# EasyEDA Pro project ESP32S3_DMX_RDM_2026-06-09.epro, schematic Schematic

## Sheets
1 P1: Create Date: 2026-06-09; Page Name: P1; Project Name: ESP32S3_DMX_RDM_2026-06-09; Schematic Name: Schematic1; Update Date: 2026-06-09; Company: 嘉立创EDA; Page Size: A3; Version: V1.0
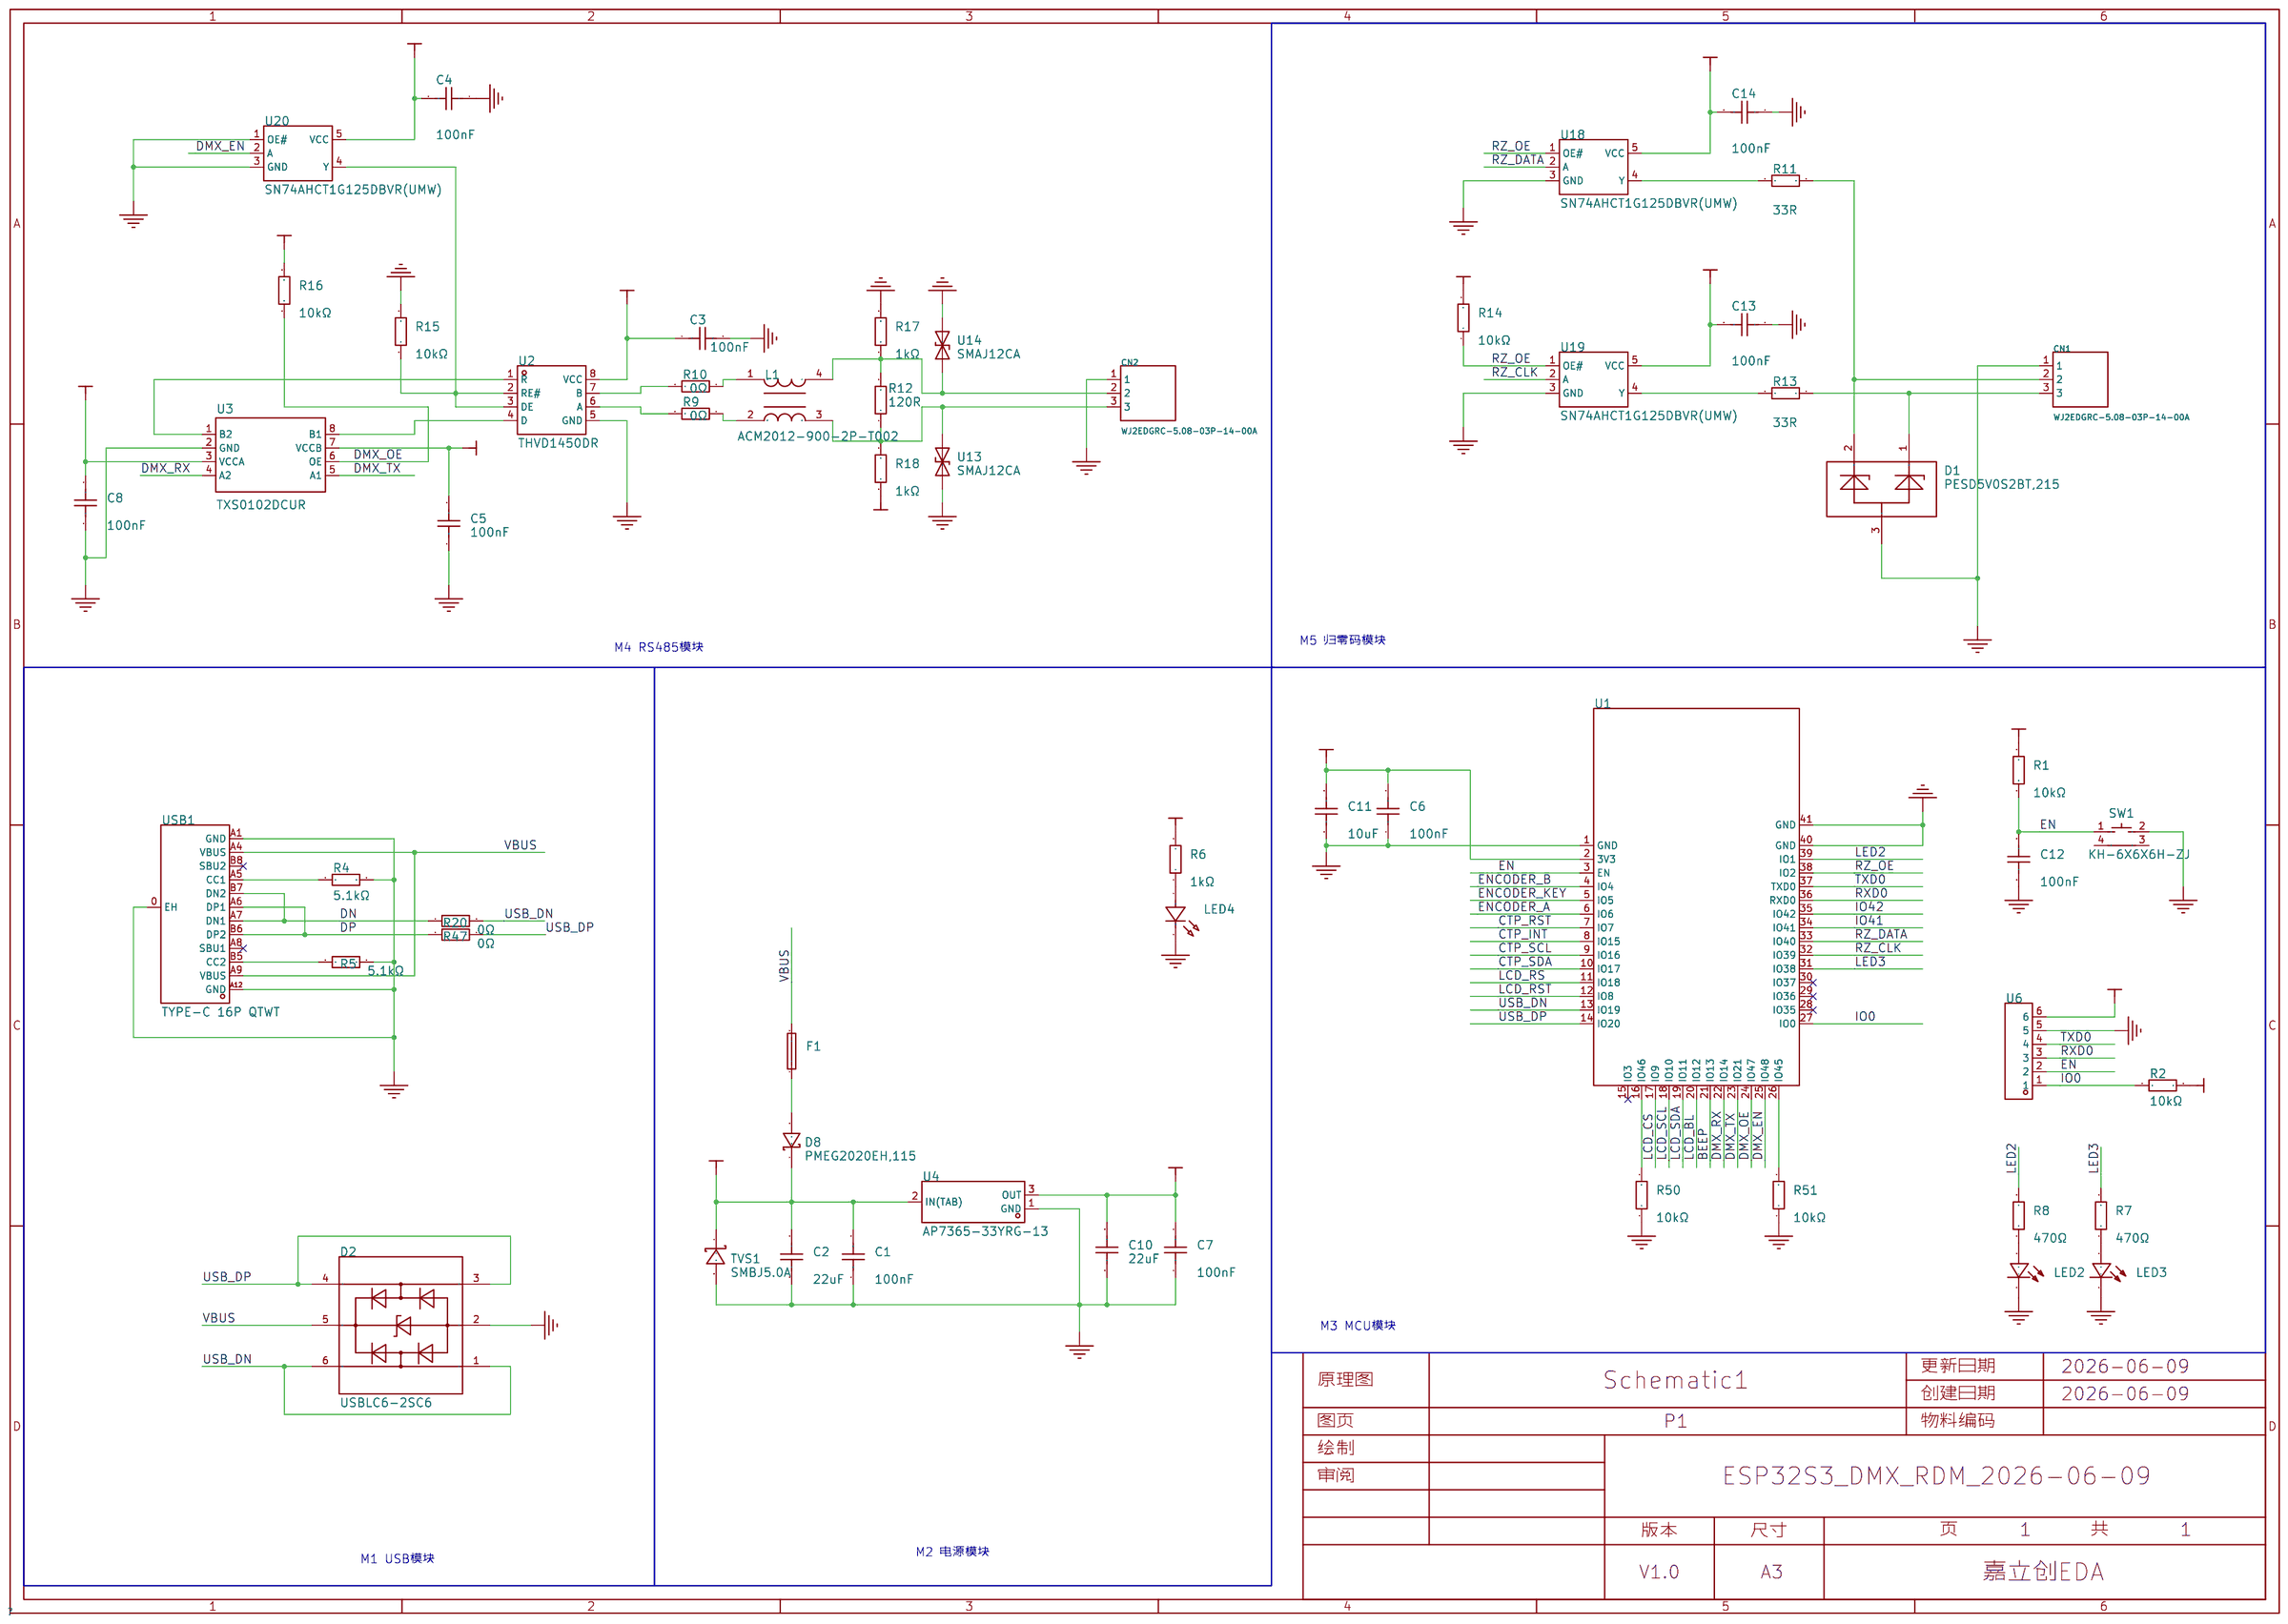
[diagram p3: P1]
2 P2: Create Date: 2026-06-11; Page Name: P2; Schematic Name: Schematic; Update Date: 2026-06-11
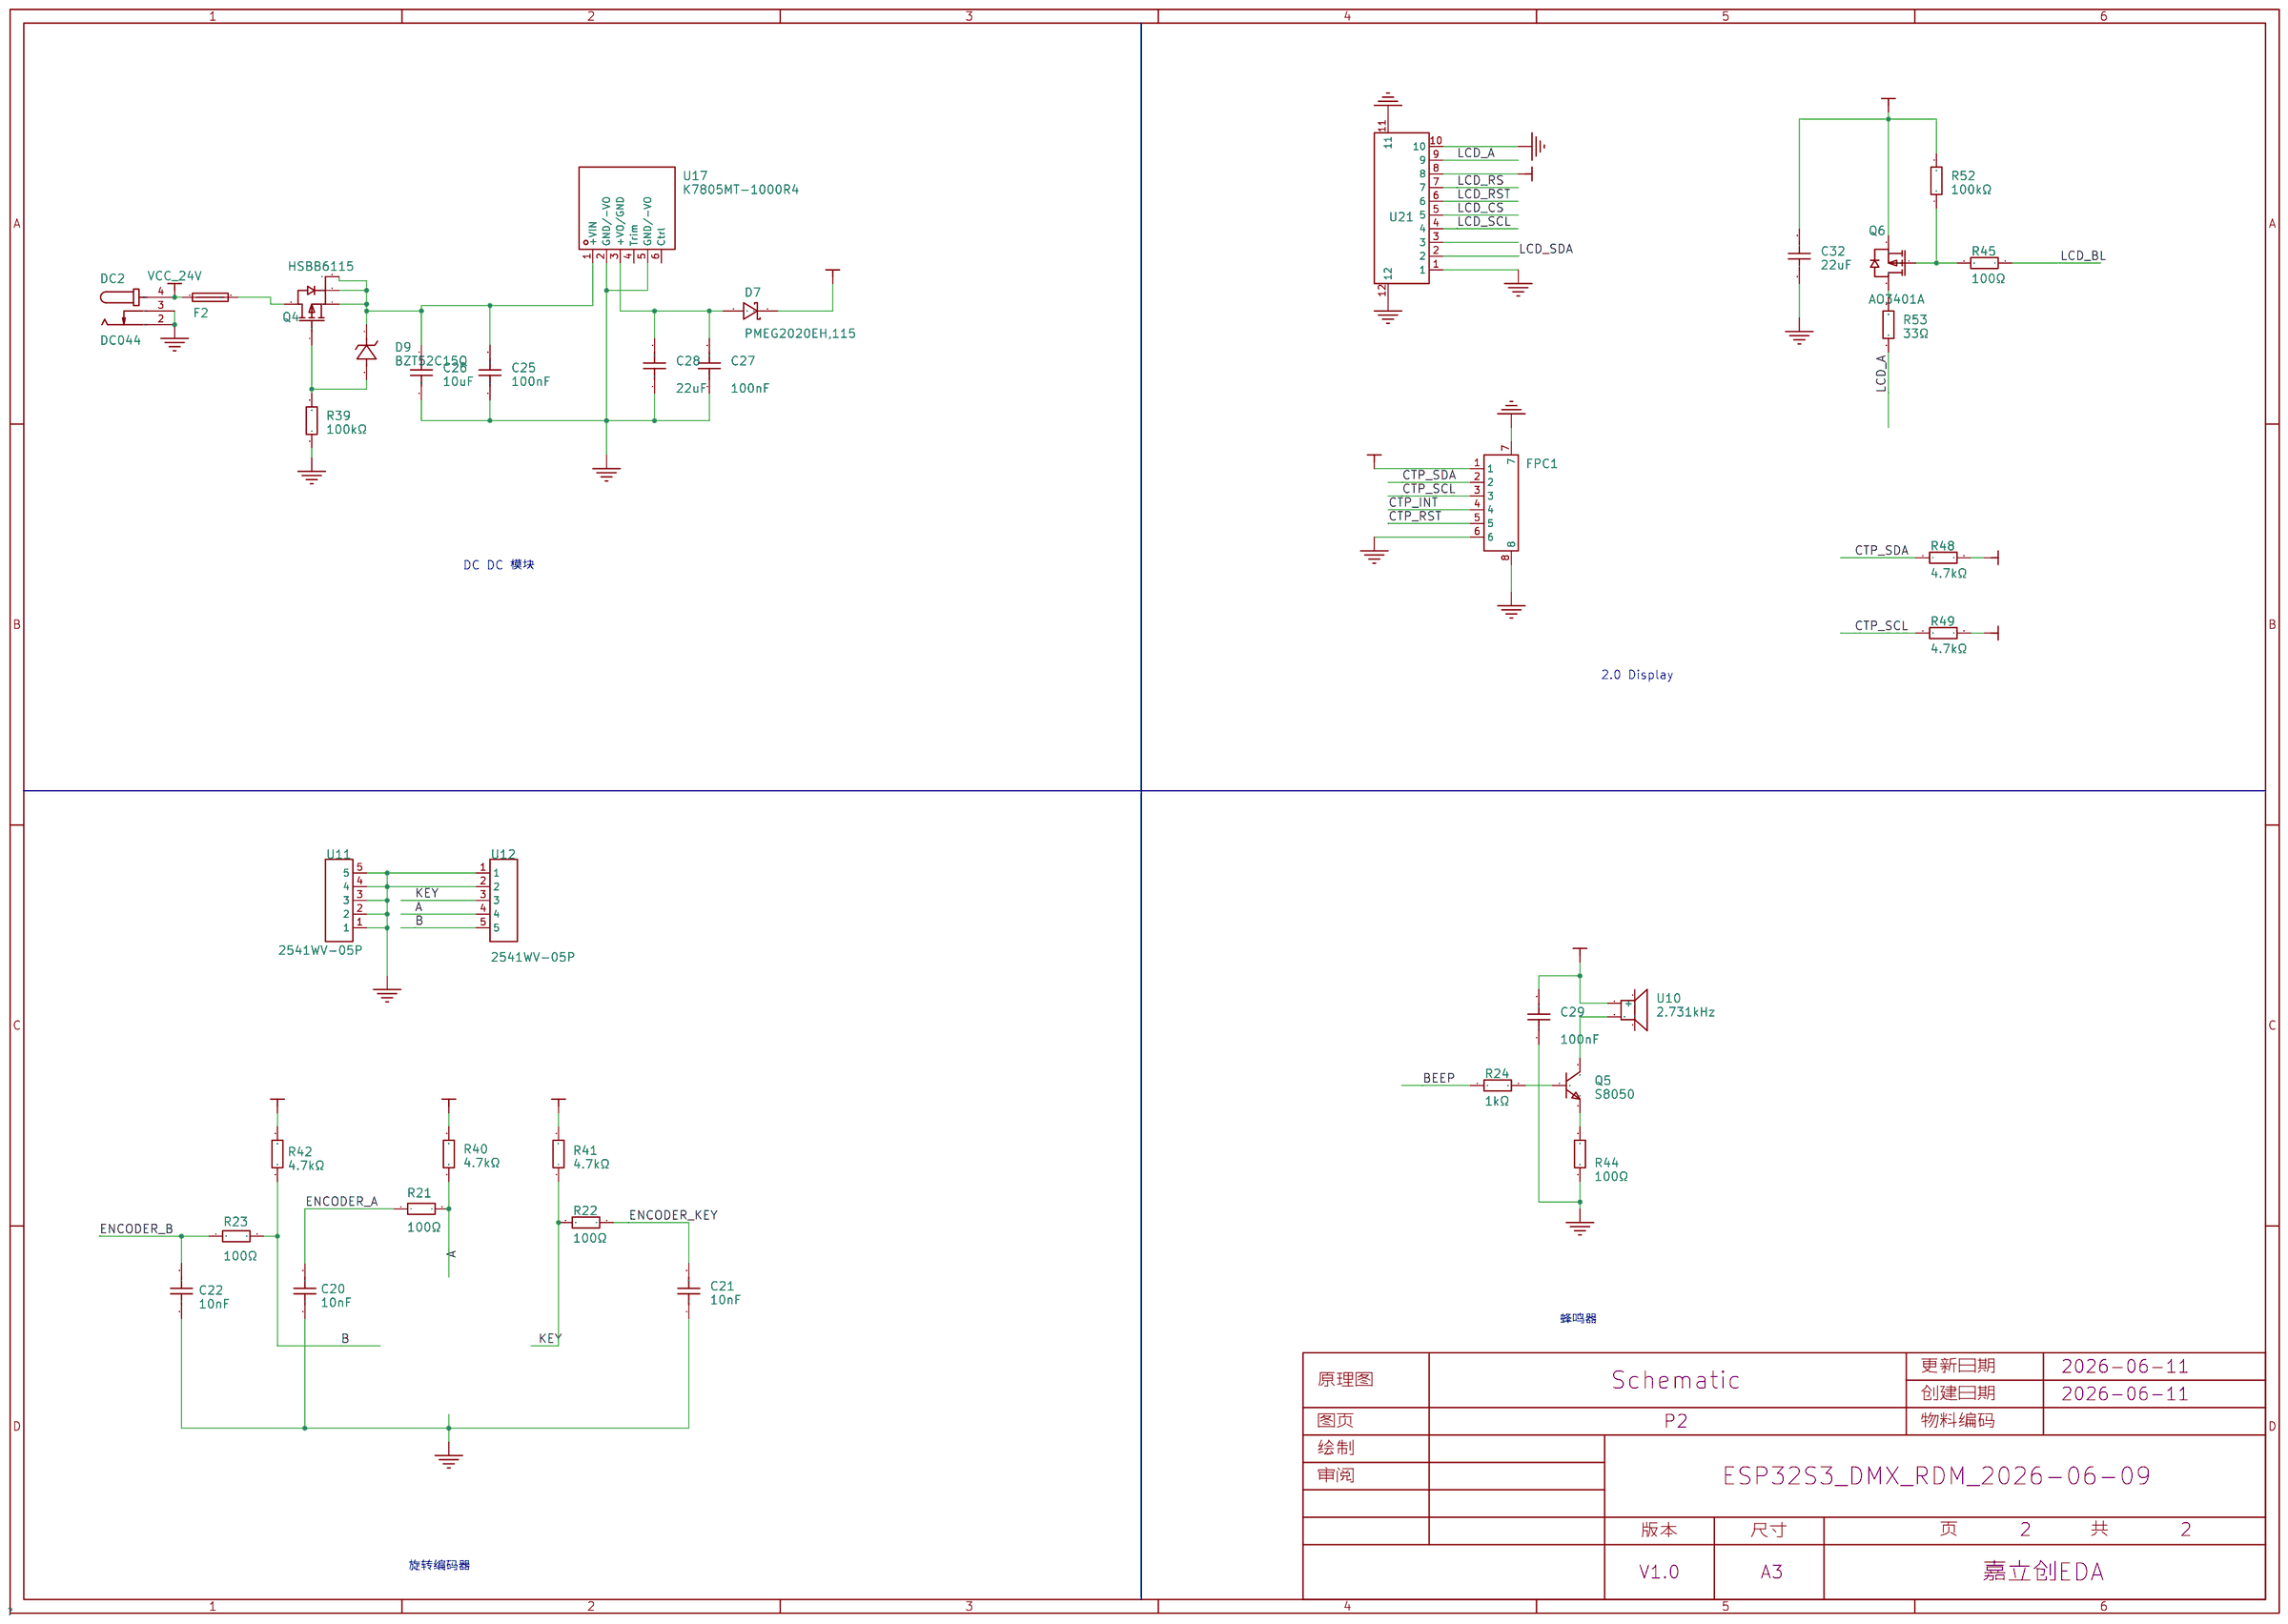
[diagram p4: P2]

## Parts
sheet P1
C1  100nF  [C0805]
C2  22uF  [C0805]
C3  100nF  [C0805]
C4  100nF  [C0805]
C5  100nF  [C0805]
C6  100nF  [C0805]
C7  100nF  [C0805]
C8  100nF  [C0805]
C10  22uF  [C0805]
C11  10uF  [C0805]
C12  100nF  [C0805]
C13  100nF  [C0805]
C14  100nF  [C0805]
CN1  WJ2EDGRC-5.08-03P-14-00A  [CONN-TH_3P-P5.08_WJ2EDGRC-5.08-3P]
CN2  WJ2EDGRC-5.08-03P-14-00A  [CONN-TH_3P-P5.08_WJ2EDGRC-5.08-3P]
D1  PESD5V0S2BT,215  [SOT-23_L2.9-W1.3-P1.90-LS2.4-BR]
D2  USBLC6-2SC6  [SOT-23-6_L2.9-W1.6-P0.95-LS2.8-BL]
D8  PMEG2020EH,115  [SOD-123FL_L2.6-W1.6-LS3.4-R-FD]
F1  1206L050/36NR  [F1206]
L1  ACM2012-900-2P-T002  [IND-SMD_4P-L2.0-W1.2-TL]
LED2  MHK1375CGBTD  [LED-TH_MHK1375CGBTD]
LED3  MHK1375CGBTD  [LED-TH_MHK1375CGBTD]
LED4  MHK1375CRBTD  [LED-TH_MHK1375CRBTD]
R1  10kΩ  [R0805]
R2  10kΩ  [R0805]
R4  5.1kΩ  [R0805]
R5  5.1kΩ  [R0805]
R6  1kΩ  [R0805]
R7  470Ω  [R0805]
R8  470Ω  [R0805]
R9  0Ω  [R0805]
R10  0Ω  [R0805]
R11  33R  [R0805]
R12  120R  [R0805]
R13  33R  [R0805]
R14  10kΩ  [R0805]
R15  10kΩ  [R0805]
R16  10kΩ  [R0805]
R17  1kΩ  [R0805]
R18  1kΩ  [R0805]
R20  0Ω  [R0805]
R47  0Ω  [R0805]
R50  10kΩ  [R0805]
R51  10kΩ  [R0805]
SW1  KH-6X6X6H-ZJ  [SW-TH_KH-6X6X6H-ZJ-A]
TVS1  SMBJ5.0A  [SMB_L4.6-W3.6-LS5.3-RD]
U1  2.4GHz  [WIRELM-SMD_ESP32-S3-WROOM-1]
U2  THVD1450DR  [SOIC-8_L4.9-W3.9-P1.27-LS6.0-BL]
U3  TXS0102DCUR  [VSON8_L2.0-W2.3-P0.50-LS3.1-BL]
U4  AP7365-33YRG-13  [SOT-89-3_L4.5-W2.5-P1.50-LS4.2-BR]
U6  DS1024-1x6R2  [HDR-TH_6P-P2.54-H-F-W10.0-N]
U13  SMAJ12CA  [SMA_L4.3-W2.7-LS5.1-BI]
U14  SMAJ12CA  [SMA_L4.3-W2.7-LS5.1-BI]
U18  SN74AHCT1G125DBVR(UMW)  [SOT-23-5_L3.0-W1.5-P0.95-LS2.8-BL]
U19  SN74AHCT1G125DBVR(UMW)  [SOT-23-5_L3.0-W1.5-P0.95-LS2.8-BL]
U20  SN74AHCT1G125DBVR(UMW)  [SOT-23-5_L3.0-W1.5-P0.95-LS2.8-BL]
USB1  TYPE-C 16P QTWT  [USB-TYPE-C-SMD_TYPE-C-16P-QTWT]
sheet P2
C20  10nF  [C0805]
C21  10nF  [C0805]
C22  10nF  [C0805]
C25  100nF  [C0805]
C26  10uF  [C0805]
C27  100nF  [C0805]
C28  22uF  [C0805]
C29  100nF  [C0805]
C32  22uF  [C0805]
D7  PMEG2020EH,115  [SOD-123FL_L2.6-W1.6-LS3.4-R-FD]
D9  BZT52C15Q  [SOD-123_L2.6-W1.7-LS3.5-RD]
DC2  DC044  [DC-IN-TH_DC044]
F2  1206L050/36NR  [F1206]
FPC1  05B20L06P  [FPC-SMD_6P-P0.50_05B20L06P]
Q4  HSBB6115  [DFN-8_L3.0-W3.0-P0.65-BL-1]
Q5  S8050  [SOT-23-3_L2.9-W1.3-P1.90-LS2.4-BR]
Q6  AO3401A  [SOT-23-3_L2.9-W1.3-P1.90-LS2.4-BR]
R21  100Ω  [R0805]
R22  100Ω  [R0805]
R23  100Ω  [R0805]
R24  1kΩ  [R0805]
R39  100kΩ  [R0805]
R40  4.7kΩ  [R0805]
R41  4.7kΩ  [R0805]
R42  4.7kΩ  [R0805]
R44  100Ω  [R0805]
R45  100Ω  [R0805]
R48  4.7kΩ  [R0805]
R49  4.7kΩ  [R0805]
R52  100kΩ  [R0805]
R53  33Ω  [R0805]
U10  2.731kHz  [BUZ-SMD_4P-L8.5-W8.5-P8.50-TL-A]
U11  2541WV-05P  [HDR-TH_5P-P2.54-V-M]
U12  2541WV-05P  [HDR-TH_5P-P2.54-V-M]
U17  K7805MT-1000R4  [PWRM-SMD_K78XXMT-1000R4]
U21  HC-FPC-0.5-10P-CSH20  [FPC-SMD_10P-P0.50_HC-FPC-0.5-10P-CSH20]

## Library data of the parts
C1 C3-C8 C12-C14 C25 C27 C29 = CC0805KRX7R9BB104: 容值:100nF;精度:±10%;额定电压:50V;温度系数:X7R;; LCSC Part Name: 100nF ±10% 50V; Supplier Part: C49678; Manufacturer: YAGEO(国巨); Supplier Footprint: 0805; JLCPCB Part Class: Basic Part; Datasheet: https://item.szlcsc.com/datasheet/CC0805KRX7R9BB104/50686.html; Supplier: LCSC; Tolerance: ±10%; Voltage Rating: 50V; Temperature Coefficient: X7R
C2 C10 C28 C32 = GRM21BR61A226ME51K: 容值:22uF;精度:±20%;额定电压:10V;温度系数:X5R;; LCSC Part Name: 22uF ±20% 10V; Supplier Part: GRM21BR61A226ME51K.1; Manufacturer: muRata(村田); Supplier Footprint: 0805; JLCPCB Part Class: Extended Part; Datasheet: https://item.szlcsc.com/datasheet/GRM21BR61A226ME51K/2269894.html; Supplier: LCSC; Tolerance: ±20%; Voltage Rating: 10V; Temperature Coefficient: X5R
C11 = GRM21BR61C106KE15K: 容值:10uF;精度:±10%;额定电压:16V;温度系数:X5R;; LCSC Part Name: 10uF ±10% 16V; Supplier Part: GRM21BR61C106KE15K.1; Manufacturer: muRata(村田); Supplier Footprint: 0805; JLCPCB Part Class: Extended Part; Datasheet: https://item.szlcsc.com/datasheet/GRM21BR61C106KE15K/397163.html; Supplier: LCSC; Tolerance: ±10%; Voltage Rating: 16V; Temperature Coefficient: X5R
CN1 CN2 = WJ2EDGRC-5.08-03P-14-00A: 连接器类型:板端/插座-闭口;固定方式:卡扣固定;结构:1x3P;间距:5.08mm;颜色:绿色;安装方式:弯插;排数:1;每排PIN数:3;额定电流:10A;额定电压:300V;线规 - AWG:-;线规 - 平方毫米:-;工作温度:-40℃~+105℃;; LCSC Part Name: 卡扣固定 1x3P 5.08mm 排数:1 每排P数:3; Supplier Part: C8377; Manufacturer: KANGNEX(康奈克斯电气); Supplier Footprint: 弯插,P=5.08mm; JLCPCB Part Class: Extended Part; Datasheet: https://item.szlcsc.com/datasheet/WJ2EDGRC-5.08-03P-14-00A/8871.html; Supplier: LCSC; Connector Type: 板端/插座-闭口; Termination Style: 卡扣固定; Number of Positions or Pins: 1x3P; Pitch: 5.08mm; Color: 绿色; Mounting Type: 弯插; Number of Pins: 3P; Number of Rows: 1; Number of PINs Per Row: 3; Current Rating: 10A; Voltage Rating (Max): 300V; Operating Temperature: -40℃~+105℃
D1 = PESD5V0S2BT,215: 极性:双向;反向截止电压(Vrwm):5V;钳位电压:14V;峰值脉冲电流(Ipp):12A;峰值脉冲功率(Ppp):130W@8/20us;击穿电压:5.5V;; LCSC Part Name: 双向ESD; Supplier Part: C49338; Manufacturer: Nexperia(安世); Supplier Footprint: SOT-23; JLCPCB Part Class: Extended Part; Datasheet: https://item.szlcsc.com/datasheet/PESD5V0S2BT%252C215/50346.html; Supplier: LCSC; Polarity: 双向; Reverse Stand-Off Voltage (Vrwm): 5V; Clamping Voltage: 14V; Peak Pulse Current (Ipp): 12A; Peak Pulse Power Dissipation (Ppp): 130W@8/20us; Voltage - Breakdown: 5.5V; Reverse Leakage Current (Ir): 5nA; Number of Channels: 双路; level of protection: IEC 61000-4-5；IEC 61000-4-2; Type: ESD; Junction Capacitance: 35pF
D2 = USBLC6-2SC6_C7519: 极性:单向;反向截止电压(Vrwm):5.25V;钳位电压:17V;峰值脉冲电流(Ipp):5A;击穿电压:6V;; LCSC Part Name: 单向ESD; Supplier Part: USBLC6-2SC6.1; Manufacturer: ST(意法半导体); Supplier Footprint: SOT-23-6L; JLCPCB Part Class: Extended Part; Datasheet: https://item.szlcsc.com/datasheet/USBLC6-2SC6/7996.html; Supplier: LCSC; Polarity: 单向; Reverse Stand-Off Voltage (Vrwm): 5.25V; Clamping Voltage: 17V; Peak Pulse Current (Ipp): 5A; Voltage - Breakdown: 6V; Reverse Leakage Current (Ir): 150nA; Number of Channels: 双路; Operating Temperature: -40℃~+125℃; level of protection: IEC 61000-4-2; Type: ESD; Junction Capacitance: 3.5pF
D7 D8 = PMEG2020EH,115: 二极管配置:1个独立式;正向压降(Vf):525mV@2A;直流反向耐压(Vr):20V;整流电流:2A;; LCSC Part Name: 电压:20V 电流:2A; Supplier Part: C456104; Manufacturer: Nexperia(安世); Supplier Footprint: SOD-123F; JLCPCB Part Class: Extended Part; Datasheet: https://item.szlcsc.com/datasheet/PMEG2020EH%252C115/458867.html; Supplier: LCSC; Diode Configuration: 1个独立式; Voltage - Forward(Vf@If): 525mV@2A; Voltage - DC Reverse(Vr): 20V; Current - Rectified: 2A; Reverse Leakage Current (Ir): 200uA@20V; Non-Repetitive Peak Forward Surge Current: 9A
F1 F2 = 1206L050/36NR: 最大电压:36V;最大电流:10A;保持电流:500mA;跳闸电流:1A;; Supplier Part: C20616702; Manufacturer: LUTE(陆特); Supplier Footprint: 1206; JLCPCB Part Class: 扩展库; Datasheet: https://atta.szlcsc.com/upload/public/pdf/source/20240126/B80C6588635F950DA87838E3E9CE2355.pdf; Supplier: LCSC; Operating Voltage (Max): 36V; Current Rating (Max): 10A; Hold Current: 500mA; Trip Current: 1A; Power Dissipation: 1W; Resistance - Initial (Ri) (Min): 150mΩ; Resistance - Post Trip (R1) (Max): 850mΩ; Maximum Time to Trip: 100ms; Operating Temperature: -40℃~+85℃; Voltage - Max: 16V; Current - Max: 40A; Time to Trip(Max): 1.5s; Length: 3.6mm; Width: 1.9mm; Height: 1.6mm
L1 = ACM2012-900-2P-T002: 通道数:2;电感@频率:-;阻抗@频率:90Ω@100MHz;直流电阻(DCR):190mΩ;; LCSC Part Name: 两路 贴片共模滤波器 阻抗90Ω@100MHz 停产; Supplier Part: C19972; Manufacturer: TDK; Supplier Footprint: SMD-4P,2x1.2mm; JLCPCB Part Class: Extended Part; Datasheet: https://item.szlcsc.com/datasheet/ACM2012-900-2P-T002/20681.html; Supplier: LCSC; Number of Lines: 2; Current Rating: 400mA; Impedance @ Frequency: 90Ω@100MHz; Voltage Rating - DC: 50V; Voltage Withstand: 50V; DC Resistance(DCR): 190mΩ; Operating Temperature: -40℃~+85℃
LED2 LED3 = MHK1375CGBTD: 灯头类型:组装式圆形灯头;发光颜色:黄绿色;功率:78mW;正向电流:20mA;主波长:568nm;二极管配置:-;透镜颜色:雾状绿透镜;色温:-;发光角度:80°;载带方式:-;工作温度:-25℃~+85℃;; LCSC Part Name: 普绿/黄绿; Supplier Part: C409769; Manufacturer: MEIHUA(美华); Supplier Footprint: 插件,P=2.54mm; JLCPCB Part Class: 扩展库; Datasheet: https://atta.szlcsc.com/upload/public/pdf/source/20190807/C409769_BD2FEBD402124B53381C1A24DEF8BEC4.pdf; Supplier: LCSC; Lamp Holder Type: 组装式圆形灯头; Emitted Color: 黄绿色; Power Dissipation: 78mW; Forward Current: 20mA; Dominant Wavelength: 568nm; Lens Color: 雾状绿透镜; Viewing Angle: 80°; Operating Temperature: -25℃~+85℃
LED4 = MHK1375CRBTD: 灯头类型:-;发光颜色:红色;正向压降(Vf):2.05V;功率:75mW;正向电流:20mA;波长:628nm;二极管配置:-;透镜颜色:雾状红透镜;色温:-;发光角度:60°;载带方式:-;工作温度:-25℃~+85℃;; LCSC Part Name: 红灯; Supplier Part: C2764901; Manufacturer: MEIHUA(美华); Supplier Footprint: 插件,P=2.54mm; JLCPCB Part Class: 扩展库; Datasheet: https://item.szlcsc.com/datasheet/MHK1375CRBTD/2899589.html; Supplier: LCSC; Illumination Color: 红色; Voltage - Forward(Vf): 2.05V; Power(Watts): 75mW; Forward Current: 20mA; Wavelength - Dominant: 628nm; Lens Color: 雾状红透镜; Viewing Angle: 60°; Operating Temperature: -25℃~+85℃
R1 R2 R14-R16 R50 R51 = RC0805JR-0710KL: 电阻类型:厚膜电阻;阻值:10kΩ;精度:±5%;功率:125mW;最大工作电压:150V;温度系数:±100ppm/℃;; LCSC Part Name: 厚膜电阻 10kΩ ±5% 125mW; Supplier Part: C100047; Manufacturer: YAGEO(国巨); Supplier Footprint: 0805; JLCPCB Part Class: Extended Part; Datasheet: https://atta.szlcsc.com/upload/public/pdf/source/20170708/1499509500945.pdf; Supplier: LCSC; Type: 厚膜电阻; Tolerance: ±5%; Power(Watts): 125mW; Overload Voltage (Max): 150V; Temperature Coefficient: ±100ppm/℃; Operating Temperature Range: -55℃~+155℃
R4 R5 = RC0805FR-075K1L: 电阻类型:厚膜电阻;阻值:5.1kΩ;精度:±1%;功率:125mW;工作电压:150V;温度系数:±100ppm/℃;; LCSC Part Name: 厚膜电阻 5.1kΩ ±1% 125mW; Supplier Part: C84375; Manufacturer: YAGEO(国巨); Supplier Footprint: 0805; JLCPCB Part Class: Extended Part; Datasheet: https://item.szlcsc.com/datasheet/RC0805FR-075K1L/85545.html; Supplier: LCSC; Type: 厚膜电阻; Tolerance: ±1%; Power(Watts): 125mW; Voltage-Supply(Max): 150V; Temperature Coefficient: ±100ppm/℃; Operating Temperature: -55℃~+155℃
R6 R17 R18 R24 = RC0805JR-071KL: 电阻类型:厚膜电阻;阻值:1kΩ;精度:±5%;功率:125mW;最大工作电压:150V;温度系数:±100ppm/℃;; LCSC Part Name: 厚膜电阻 1kΩ ±5% 125mW; Supplier Part: C100046; Manufacturer: YAGEO(国巨); Supplier Footprint: 0805; JLCPCB Part Class: Extended Part; Datasheet: https://atta.szlcsc.com/upload/public/pdf/source/20170708/1499509500945.pdf; Supplier: LCSC; Type: 厚膜电阻; Tolerance: ±5%; Power(Watts): 125mW; Overload Voltage (Max): 150V; Temperature Coefficient: ±100ppm/℃; Operating Temperature Range: -55℃~+155℃
R7 R8 = RC0805FR-07470RL: 电阻类型:厚膜电阻;阻值:470Ω;精度:±1%;功率:125mW;工作电压:150V;温度系数:±100ppm/℃;; LCSC Part Name: 厚膜电阻 470Ω ±1% 125mW; Supplier Part: C114564; Manufacturer: YAGEO(国巨); Supplier Footprint: 0805; JLCPCB Part Class: Extended Part; Datasheet: https://item.szlcsc.com/datasheet/RC0805FR-07470RL/115808.html; Supplier: LCSC; Type: 厚膜电阻; Tolerance: ±1%; Power(Watts): 125mW; Voltage-Supply(Max): 150V; Temperature Coefficient: ±100ppm/℃; Operating Temperature: -55℃~+155℃
R9 R10 R20 R47 = RC0805FR-070RL: 电阻类型:厚膜电阻;阻值:0Ω;精度:±1%;功率:125mW;工作电压:150V;温度系数:-;; LCSC Part Name: 厚膜电阻 0Ω ±1% 125mW; Supplier Part: C100045; Manufacturer: YAGEO(国巨); Supplier Footprint: 0805; JLCPCB Part Class: Extended Part; Datasheet: https://item.szlcsc.com/datasheet/RC0805FR-070RL/101259.html; Supplier: LCSC; Type: 厚膜电阻; Tolerance: ±1%; Power(Watts): 125mW; Voltage-Supply(Max): 150V; Operating Temperature: -55℃~+155℃
R11 R13 = RC0805FR-0733RL: 电阻类型:厚膜电阻;阻值:33Ω;精度:±1%;功率:125mW;工作电压:150V;温度系数:±100ppm/℃;; LCSC Part Name: 厚膜电阻 33Ω ±1% 125mW; Supplier Part: RC0805FR-0733RL.1; Manufacturer: YAGEO(国巨); Supplier Footprint: 0805; JLCPCB Part Class: Extended Part; Datasheet: https://item.szlcsc.com/datasheet/RC0805FR-0733RL/137633.html; Supplier: LCSC; Type: 厚膜电阻; Tolerance: ±1%; Power(Watts): 125mW; Voltage-Supply(Max): 150V; Temperature Coefficient: ±100ppm/℃; Operating Temperature: -55℃~+155℃
R12 = RC0805FR-07120RL: 电阻类型:厚膜电阻;阻值:120Ω;精度:±1%;功率:125mW;工作电压:150V;温度系数:±100ppm/℃;; LCSC Part Name: 厚膜电阻 120Ω ±1% 125mW; Supplier Part: RC0805FR-07120RL.1; Manufacturer: YAGEO(国巨); Supplier Footprint: 0805; JLCPCB Part Class: Extended Part; Datasheet: https://item.szlcsc.com/datasheet/RC0805FR-07120RL/115485.html; Supplier: LCSC; Type: 厚膜电阻; Tolerance: ±1%; Power(Watts): 125mW; Voltage-Supply(Max): 150V; Temperature Coefficient: ±100ppm/℃; Operating Temperature: -55℃~+155℃
SW1 = KH-6X6X6H-ZJ: 电路结构:单刀单掷;按钮形状:圆形按钮;作用力:-;安装方式:弯插;开关长度:7.5mm;开关宽度:6mm;开关高度:11.5mm;带支架:带支架;触点电流:-;额定电压:-;带灯:无;工作寿命:10万次;; LCSC Part Name: 7.5mm 6mm 11.5mm; Supplier Part: C2837542; Manufacturer: kinghelm(金航标); Supplier Footprint: 插件; JLCPCB Part Class: Extended Part; Datasheet: https://item.szlcsc.com/datasheet/KH-6X6X6H-ZJ/3009612.html; Supplier: LCSC; Circuit: 单刀单掷; Actuator Style: 圆形按钮; Mounting Type: 弯插; Length: 7.5mm; Width: 6mm; Switch Height: 11.5mm; with Bracket: 带支架; Actuator/Cap Color: 黑色; With Lamp: 无; Termination Style: PC引脚; Life: 10万次
TVS1 = SMBJ5.0A: 极性:单向;反向截止电压(Vrwm):5V;钳位电压:9.2V;峰值脉冲电流(Ipp):65.22A;峰值脉冲功率(Ppp):600W@10/1000us;击穿电压:6.4V;; LCSC Part Name: 单向TVS 5V截止 峰值浪涌电流：65.22A; Supplier Part: SMBJ5.0A_C357965.1; Manufacturer: DOWO(东沃); Supplier Footprint: SMB(DO-214AA); JLCPCB Part Class: Extended Part; Datasheet: https://item.szlcsc.com/datasheet/SMBJ5.0A/333049.html; Supplier: LCSC; Polarity: 单向; Reverse Stand-Off Voltage (Vrwm): 5V; Clamping Voltage: 9.2V; Peak Pulse Current (Ipp): 65.22A; Peak Pulse Power Dissipation (Ppp): 600W@10/1000us; Voltage - Breakdown: 6.4V; Reverse Leakage Current (Ir): 800uA; Type: TVS
U1 = ESP32-S3-WROOM-1-N16R8: 核心芯片:ESP32-S3R8;频率:2.4GHz;天线形式:板载PCB天线;发射功率:20.5dBm;接收灵敏度:-103.5dBm;; LCSC Part Name: 不带固件 通用型Wi-Fi+低功耗蓝牙MCU模组; Supplier Part: ESP32-S3-WROOM-1(N16R8).1; Manufacturer: ESPRESSIF(乐鑫); Supplier Footprint: SMD,25.5x18mm; JLCPCB Part Class: Extended Part; Datasheet: https://item.szlcsc.com/datasheet/ESP32-S3-WROOM-1-N16R8/3198300.html; Supplier: LCSC; Utilized IC / Part: ESP32-S3R8; Interface Type: I2C；GPIO；UART；SPI；USB；I2S; Antenna Type: 板载PCB天线; Output Power: 20.5dBm; Voltage - Supply: 3V~3.6V; Receive  Current: 95mA; Send  Current: 355mA; Sensitivity: -103.5dBm; Operating Temperature: -40℃~+65℃
U2 = THVD1450DR: 类型:收发器;数据速率:50Mbps;; LCSC Part Name: 3V至5.5V单电源供电RS-485/RS-422收发器; Supplier Part: THVD1450DR.1; Manufacturer: TI(德州仪器); Supplier Footprint: SOIC-8; JLCPCB Part Class: Extended Part; Datasheet: https://www.ti.com/cn/lit/gpn/thvd1452; Supplier: LCSC; Type: 收发器; Number of Drivers: 1; Number of Receivers: 1; Voltage - Supply: 3V~5.5V; Data Rate: 50Mbps; Number of Nodes: 256; ESD Protect: ±18kV; Operating Temperature: -40℃~+125℃; Quiescent Supply Current: 3mA; Communication Mode: 半双工
U3 = TXS0102DCUR: 数据速率:24Mbps;工作电压(VCCA):1.65V~3.6V;工作电压(VCCB):2.3V~5.5V;元件数:1;每个电路通道数:2;; LCSC Part Name: 24Mbps 2位双向电平转换器; Supplier Part: TXS0102DCUR.1; Manufacturer: TI(德州仪器); Supplier Footprint: VSSOP-8; JLCPCB Part Class: Extended Part; Datasheet: https://www.ti.com/lit/ds/symlink/txs0102.pdf?ts=1761116535177; Supplier: LCSC; Channel Type: 双向; Data Rate: 24Mbps; Voltage - Supply(VCCA): 1.65V~3.6V; Voltage - Supply(VCCB): 2.3V~5.5V; Number of Elements: 1; Number of Circuits: 2; Output Type: 开漏；推挽式; Operating Temperature: -40℃~+85℃; Features: 自动方向检测
U4 = AP7365-33YRG-13: 输出极性:正极;工作电压:6V;输出电压:3.3V;输出电流:600mA;电源纹波抑制比(PSRR):65dB@(1kHz);输出类型:固定;; LCSC Part Name: 3.3V 600mA 6V; Supplier Part: AP7365-33YRG-13.1; Manufacturer: DIODES(美台); Supplier Footprint: SOT-89; JLCPCB Part Class: Extended Part; Datasheet: https://item.szlcsc.com/datasheet/AP7365-33YRG-13/464835.html; Supplier: LCSC; Output Configuration: 正极; Voltage - Supply: 6V; Output Voltage: 3.3V; Output Current: 600mA; Power Supply Rejection Ratio (PSRR): 65dB@(1kHz); Voltage Dropout: 600mV@(600mA); standby current: 35uA; Features: 过流保护；使能控制；短路保护；热关断; Operating Temperature: -40℃~+85℃@(Ta); Output Type: 固定; Number of Outputs: 1
U6 = DS1024-1x6R2: 插孔结构:1x6P;间距:2.54mm;圆孔/方孔:方孔;安装方式:弯插;排数:单排;总孔位数:6P;额定电流:3A;额定电压:250V;插孔方向:侧面;塑高:2.5mm;触头镀层:金镍;工作温度:-40℃~+105℃;; LCSC Part Name: 黑色 1x6P 间距:2.54mm 弯插; Supplier Part: C7509541; Manufacturer: CONNFLY; Supplier Footprint: 弯插,P=2.54mm; JLCPCB Part Class: Extended Part; Datasheet: https://item.szlcsc.com/datasheet/DS1024-1x6R2/8601977.html; Supplier: LCSC; Holes Structure: 1x6P; Pitch: 2.54mm; Circular Hole / Square Hole: 方孔; Mounting Type: 弯插; Number of Rows: 单排; Number of Positions: 6P; Current Rating: 3A; Voltage Rating (Max): 250V; Holes Direction: 侧面; Insulation Height: 2.5mm; Contact Plating: 金镍; Operating Temperature: -40℃~+105℃
U13 U14 = SMAJ12CA_C3001959: 极性:双向;反向截止电压(Vrwm):12V;钳位电压:19.9V;峰值脉冲电流(Ipp):20.1A;峰值脉冲功率(Ppp):400W;击穿电压:13.3V;; LCSC Part Name: 双向TVS 12V截止 峰值脉冲电流：20.1A; Supplier Part: C3001959; Manufacturer: UMW(友台半导体); Supplier Footprint: DO-214AC(SMA); JLCPCB Part Class: Extended Part; Datasheet: https://item.szlcsc.com/datasheet/SMAJ12CA/3486666.html; Supplier: LCSC; Polarity: 双向; Reverse Stand-Off Voltage (Vrwm): 12V; Clamping Voltage: 19.9V; Peak Pulse Current (Ipp): 20.1A; Peak Pulse Power Dissipation (Ppp): 400W; Voltage - Breakdown: 13.3V; Reverse Leakage Current (Ir): 1uA; Type: TVS
U18-U20 = SN74AHCT1G125DBVR(UMW): 逻辑类型:-;通道数:1;工作电压:4.5V~5.5V;静态电流(Iq):10uA;传播延迟(tpd):12ns@5V,50pF;; LCSC Part Name: 三态输出，单路总线缓冲门; Supplier Part: C20617903; Manufacturer: UMW(友台半导体); Supplier Footprint: SOT-23-5; JLCPCB Part Class: Extended Part; Datasheet: https://item.szlcsc.com/datasheet/SN74AHCT1G125DBVR(UMW)/21992700.html; Supplier: LCSC; Number of Channels: 1; Voltage - Supply: 4.5V~5.5V; Quiescent Current: 10uA; Current - Output Low(IOL): 8mA; Current - Output High(IOH): 8mA; Input Logic Level - High: 2V; Input Logic Level - Low: 800mV; Output Logic Level - High: 4.4V；3.8V; Output Logic Level - Low: 440mV; Series: 74AHCT; Propagation Delay: 12ns@5V,50pF; Operating Temperature: -40℃~+125℃; Input Number: 1; Features: 可控输出使能
USB1 = TYPE-C 16P QTWT: 连接器类型:Type-C;协议标准:-;公母:母;安装方式:卧贴;触点数量:16P;端口数量:1;额定电流 - 电源:3A;工作温度:-25℃~+85℃;; LCSC Part Name: 16P卧贴母座; Supplier Part: TYPE-C 16P QTWT.1; Manufacturer: SHOU HAN(首韩); Supplier Footprint: SMD; JLCPCB Part Class: Extended Part; Datasheet: https://item.szlcsc.com/datasheet/TYPE-C%252016P%2520QTWT/5860367.html; Supplier: LCSC; Connector Type: Type-C; Gender: 母; Mounting Type: 卧贴; Number of Contacts: 16P; Number of Ports: 1; Current Rating-Power: 3A; Voltage Rating: 5V; Connect-Disconnect Life: 5千次; Detection color: 黑色; Operating Temperature: -25℃~+85℃
C20-C22 = CC0805MRX7R9BB103: 容值:10nF;精度:±20%;额定电压:50V;温度系数:X7R;; LCSC Part Name: 10nF ±20% 50V; Supplier Part: C2169410; Manufacturer: YAGEO(国巨); Supplier Footprint: 0805; JLCPCB Part Class: Extended Part; Datasheet: https://item.szlcsc.com/datasheet/CC0805MRX7R9BB103/2261475.html; Supplier: LCSC; Tolerance: ±20%; Voltage Rating: 50V; Temperature Coefficient: X7R
C26 = GRM21BR61H106KE43L: 容值:10uF;精度:±10%;额定电压:50V;温度系数:X5R;; LCSC Part Name: 10uF ±10% 50V; Supplier Part: C440198; Manufacturer: muRata(村田); Supplier Footprint: 0805; JLCPCB Part Class: Basic Part; Datasheet: https://item.szlcsc.com/datasheet/GRM21BR61H106KE43L/439567.html; Supplier: LCSC; Tolerance: ±10%; Voltage Rating: 50V; Temperature Coefficient: X5R
D9 = BZT52C15Q: 二极管配置:1个独立式;稳压值(标称值):15V;稳压值(范围):14.25V~15.75V;耗散功率(Pd):500mW;; LCSC Part Name: 耐压:15V 电流:0.1uA@10.5V; Supplier Part: C2857059; Manufacturer: JSMSEMI(杰盛微); Supplier Footprint: SOD-123; JLCPCB Part Class: Extended Part; Datasheet: https://item.szlcsc.com/datasheet/BZT52C15Q/3057171.html; Supplier: LCSC; Diode Configuration: 1个独立式; Zener Voltage(Nom): 15V; Reverse Leakage Current (Ir): 100nA@10.5V; Zener Voltage(Range): 14.25V~15.75V; Pd - Power Dissipation: 500mW; Impedance(Zzt): 30Ω; Impedance(Zzk): 200Ω; Operating Junction Temperature Range: -55℃~+150℃; Tolerance: ±5%
DC2 = DC044: 连接器类型:DC电源插座;安装方式:弯插;触点内径:2mm;触点外径:6mm;额定电流:1A;额定电压:30V;工作温度:-25℃~+70℃;; LCSC Part Name: DC电源插座 内径:2mm 外径:6mm; Supplier Part: C668600; Manufacturer: SHOU HAN(首韩); Supplier Footprint: 插件; JLCPCB Part Class: 扩展库; Datasheet: https://item.szlcsc.com/datasheet/DC044/698543.html; Supplier: LCSC; Connector Type: DC电源插座; Mounting Type: 弯插; Inside Contact Diameter: 2mm; Outside Contact Diameter: 6mm; Current Rating: 1A; Voltage Rating (Max): 30V; Operating Temperature: -25℃~+70℃
FPC1 = 05B20L06P: 锁定特性:抽屉式;触点类型:下接;触点数量:6P;间距:0.5mm;; LCSC Part Name: 抽屉式 下接 P数:6P 间距:0.5mm; Supplier Part: C22435651; Manufacturer: HanElectricity(瀚源); Supplier Footprint: SMD,P=0.5mm,卧贴; JLCPCB Part Class: Extended Part; Datasheet: https://item.szlcsc.com/datasheet/05B20L06P/24065925.html; Supplier: LCSC; Locking Feature: 抽屉式; Contact Type: 下接; Number of Contacts: 6P; Pitch: 0.5mm; Height Above Board: 2mm; Contact Plating: 锡
Q4 = HSBB6115: 类型:1个P沟道;漏源电压(Vdss):60V;连续漏极电流(Id):26A;功率(Pd):5.2W;导通电阻(RDS(on)@Vgs,Id):25mΩ@10V,10A;阈值电压(Vgs(th)@Id):2.5V@250uA;; LCSC Part Name: 1个P沟道 耐压:60V 电流:26A; Supplier Part: C845604; Manufacturer: HUASHUO(华朔); Supplier Footprint: DFN-8(3x3); Datasheet: https://atta.szlcsc.com/upload/public/pdf/source/20201013/C845604_334669D3ABF85BD406D4C2268BF78535.pdf; Supplier: LCSC; Type: 1个P沟道; Drain Source Voltage (Vdss): 60V; Continuous Drain Current (Id): 26A; Power Dissipation (Pd): 5.2W; Drain Source On Resistance (RDS(on)@Vgs,Id): 25mΩ@10V,10A; Gate Threshold Voltage (Vgs(th)@Id): 2.5V@250uA
Q5 = S8050_C916390: 晶体管类型:-;集电极电流(Ic):500mA;集射极击穿电压(Vceo):25V;耗散功率(Pd):300mW;; LCSC Part Name: 电流:500mA 电压:25V; Supplier Part: C916390; Manufacturer: JSMSEMI(杰盛微); Supplier Footprint: SOT-23; JLCPCB Part Class: Extended Part; Datasheet: https://item.szlcsc.com/datasheet/S8050/990886.html; Supplier: LCSC; Current - Collector(Ic): 500mA; Collector - Emitter Voltage VCEO: 25V; Pd - Power Dissipation: 300mW; Transition frequency(fT): 150MHz; Current - Collector Cutoff: 100nA; Vce Saturation(VCE(sat)): 600mV; Emitter-Base Voltage(Vebo): 5V; Number: 1个NPN; Configuration: 独立式
Q6 = AO3401A: 漏源电压(Vdss):30V;连续漏极电流(Id):4.2A;导通电阻(RDS(on)):55mΩ@10V,4.2A;耗散功率(Pd):1.2W;阈值电压(Vgs(th)):-;; LCSC Part Name: 耐压:30V 电流:4.2A; Supplier Part: C5122001; Manufacturer: TECH PUBLIC(台舟); Supplier Footprint: SOT-23; JLCPCB Part Class: Extended Part; Datasheet: https://item.szlcsc.com/datasheet/AO3401A/5710587.html; Supplier: LCSC; Drain to Source Voltage: 30V; Current - Continuous Drain(Id): 4.2A; RDS(on): 55mΩ@10V,4.2A; Pd - Power Dissipation: 1.2W; Gate Charge(Qg): 8.5nC; Input Capacitance(Ciss): 880pF@15V; Reverse Transfer Capacitance (Crss@Vds): 65pF@15V; Operating Temperature: -55℃~+150℃
R21-R23 R44 R45 = RC0805FR-07100RL: 电阻类型:厚膜电阻;阻值:100Ω;精度:±1%;功率:125mW;工作电压:150V;温度系数:±100ppm/℃;; LCSC Part Name: 厚膜电阻 100Ω ±1% 125mW; Supplier Part: C105577; Manufacturer: YAGEO(国巨); Supplier Footprint: 0805; JLCPCB Part Class: Extended Part; Datasheet: https://item.szlcsc.com/datasheet/RC0805FR-07100RL/106792.html; Supplier: LCSC; Type: 厚膜电阻; Tolerance: ±1%; Power(Watts): 125mW; Voltage-Supply(Max): 150V; Temperature Coefficient: ±100ppm/℃; Operating Temperature: -55℃~+155℃
R39 R52 = RC0805JR-07100KL: 电阻类型:厚膜电阻;阻值:100kΩ;精度:±5%;功率:125mW;工作电压:150V;温度系数:±100ppm/℃;; LCSC Part Name: 厚膜电阻 100kΩ ±5% 125mW; Supplier Part: C100049; Manufacturer: YAGEO(国巨); Supplier Footprint: 0805; JLCPCB Part Class: Extended Part; Datasheet: https://item.szlcsc.com/datasheet/RC0805JR-07100KL/101263.html; Supplier: LCSC; Type: 厚膜电阻; Tolerance: ±5%; Power(Watts): 125mW; Voltage-Supply(Max): 150V; Temperature Coefficient: ±100ppm/℃; Operating Temperature: -55℃~+155℃
R40-R42 R48 R49 = RC0805JR-074K7L: 电阻类型:厚膜电阻;阻值:4.7kΩ;精度:±5%;功率:125mW;工作电压:150V;温度系数:±100ppm/℃;; LCSC Part Name: 厚膜电阻 4.7kΩ ±5% 125mW; Supplier Part: C105427; Manufacturer: YAGEO(国巨); Supplier Footprint: 0805; JLCPCB Part Class: Extended Part; Datasheet: https://item.szlcsc.com/datasheet/RC0805JR-074K7L/106642.html; Supplier: LCSC; Type: 厚膜电阻; Tolerance: ±5%; Power(Watts): 125mW; Voltage-Supply(Max): 150V; Temperature Coefficient: ±100ppm/℃; Operating Temperature: -55℃~+155℃
R53 = RC0805FR-0733RL: 电阻类型:厚膜电阻;阻值:33Ω;精度:±1%;功率:125mW;工作电压:150V;温度系数:±100ppm/℃;; LCSC Part Name: 厚膜电阻 33Ω ±1% 125mW; Supplier Part: C126353; Manufacturer: YAGEO(国巨); Supplier Footprint: 0805; JLCPCB Part Class: Extended Part; Datasheet: https://item.szlcsc.com/datasheet/RC0805FR-0733RL/137633.html; Supplier: LCSC; Type: 厚膜电阻; Tolerance: ±1%; Power(Watts): 125mW; Voltage-Supply(Max): 150V; Temperature Coefficient: ±100ppm/℃; Operating Temperature: -55℃~+155℃
U10 = HYG-8503A-5027: 频率:2.731kHz;声压(SPL):85dB;; LCSC Part Name: 贴片无源蜂鸣器HYG-8503A-5027 5V; Supplier Part: C18623826; Manufacturer: HYDZ(华宇); Supplier Footprint: SMD; JLCPCB Part Class: Extended Part; Datasheet: https://item.szlcsc.com/datasheet/HYG-8503A-5027/19815519.html; Supplier: LCSC; Current Consumption: 90mA; Sound Pressure Level(SPL): 85dB
U11 U12 = 2541WV-05P: 插针结构:1x5P;间距:2.54mm;圆针/方针:方针;安装方式:直插;排数:单排;总PIN位数:5P;配合针长度:6mm;塑高:2.54mm;端接针长度:3mm;触头镀层:金;工作温度:-55℃~+105℃;; LCSC Part Name: 1x5P 间距:2.54mm 方针 直插; Supplier Part: C5383114; Manufacturer: HanElectricity(瀚源); Supplier Footprint: 插件,P=2.54mm; JLCPCB Part Class: 扩展库; Datasheet: https://item.szlcsc.com/datasheet/2541WV-05P/6258474.html; Supplier: LCSC; Pin Structure: 1x5P; Pitch: 2.54mm; Circluar Pins/Square Pins: 方针; Mounting Type: 直插; Number of Rows: 单排; Number of Pins: 5P; Length of Mating Pin: 6mm; Insulation Height: 2.54mm; Length of End Connection Pin: 3mm; Contact Plating: 金; Operating Temperature: -55℃~+105℃
U17 = K7805MT-1000R4: 宽电压输入，非隔离稳压单路输出。K78_MT-1000R4系列是高效率的开关稳压器。它具有效率高，空载功耗低，短路保护功能等特性，同时在使用中无需外加散热片。; LCSC Part Name: MSL=3，上机前请烘烤 DC/DC模块电源，宽电压输入，非隔离稳压单路输出; Supplier Part: C2692189; Manufacturer: MORNSUN(金升阳); Supplier Footprint: SMD-6P,9x7mm; JLCPCB Part Class: Extended Part; Datasheet: https://item.szlcsc.com/datasheet/K7805MT-1000R4/2803124.html; Supplier: LCSC; Type: 塑封型; Number of Outputs: 1; Voltage - Supply: 8V~27V；6.5V~36V; Conversion Efficiency: 92%; Output Voltage: 5V; Output Voltage Accuracy: ±3%; Output Current(Max): 1A；500mA; Quiescent Supply Current: 100uA; Ripple Noise: 75mVp-p; Switching Frequency: 1MHz; Capacitive Load(Max): 680uF；330uF; Operating Temperature Range: -40℃~+105℃; Length: 9mm; Width: 7mm; Height: 3.1mm; Features: 短路保护；可编程输出电压；自动故障恢复
U21 = HC-FPC-0.5-10P-CSH20: 锁定特性:抽屉式;触点类型:上接;触点数量:10P;间距:0.5mm;安装方式:卧贴;工作温度:-25℃~+85℃;; LCSC Part Name: 间距:0.5mm P数:10P 抽屉式 上接; Supplier Part: C19273947; Manufacturer: HC(虹成电子); Supplier Footprint: SMD,P=0.5mm,卧贴; JLCPCB Part Class: Extended Part; Datasheet: https://item.szlcsc.com/datasheet/HC-FPC-0.5-10P-CSH20/20558497.html; Supplier: LCSC; Locking Feature: 抽屉式; Contact Type: 上接; Number of Contacts: 10P; Pitch: 0.5mm; Mounting Type: 卧贴; FFC, FCB Thickness: 0.3mm; Height Above Board: 2mm; Contact Material: 铜; Contact Plating: 锡; Operating Temperature: -25℃~+85℃

## Nets
+3.3V: C6.2 C7.2 C8.2 C10.2 C11.2 C32.2 FPC1.1 Q6.2(S) R1.2 R2.2 R14.2 R16.2 R40.2 R41.2 R42.2 R48.2 R49.2 R52.2 U1.2(3V3) U3.3(VCCA) U4.3(OUT) U6.6 U21.8
+5V: C1.2 C2.2 C3.1 C4.2 C5.2 C13.2 C14.2 C29.2 D7.1 D8.1 R6.2 R18.1 TVS1.1(K) U2.8(VCC) U3.7(VCCB) U4.2(IN(TAB)) U10.1(+) U18.5(VCC) U19.5(VCC) U20.5(VCC)
GND: C1.1 C2.1 C3.2 C4.1 C5.1 C6.1 C7.1 C8.1 C10.1 C11.1 C12.1 C13.1 C14.1 C20.1 C21.1 C22.1 C25.1 C26.2 C27.1 C28.1 C29.1 C32.1 CN1.1 CN2.1 D1.3 D2.2 DC2.2 DC2.3 FPC1.6 FPC1.7 FPC1.8 LED2.2(-) LED3.2(-) LED4.2(K) R4.2 R5.2 R15.2 R17.2 R39.1 R44.1 R50.1 R51.1 SW1.2 TVS1.2(A) U1.1(GND) U1.40(GND) U1.41(GND) U2.5(GND) U3.2(GND) U4.1(GND) U6.5 U11.1 U11.2 U11.3 U11.4 U11.5 U12.1 U12.2 U13.1(K) U14.1(K) U17.2(GND/-VO) U17.5(GND/-VO) U18.3(GND) U19.3(GND) U20.1(OE#) U20.3(GND) U21.1 U21.10 U21.11 U21.12 USB1.0(EH) USB1.A1(GND) USB1.A12(GND)
VBUS: D2.5 F1.2 USB1.A4(VBUS) USB1.A9(VBUS)
VCC_24V: DC2.4 F2.1
A: R21.2 R40.1 U12.4
B: R23.2 R42.1 U12.5
BEEP: R24.1 U1.21(IO13)
CTP_INT: FPC1.4 U1.8(IO15)
CTP_RST: FPC1.5 U1.7(IO7)
CTP_SCL: FPC1.3 R49.1 U1.9(IO16)
CTP_SDA: FPC1.2 R48.1 U1.10(IO17)
DMX_EN: U1.25(IO48) U20.2(A)
DMX_OE: R16.1 U1.24(IO47) U3.6(OE)
DMX_RX: U1.22(IO14) U3.4(A2)
DMX_TX: U1.23(IO21) U3.5(A1)
DN: R20.1 USB1.A7(DN1) USB1.B7(DN2)
DP: R47.2 USB1.A6(DP1) USB1.B6(DP2)
EN: C12.2 R1.1 SW1.1 U1.3(EN) U6.2
ENCODER_A: C20.2 R21.1 U1.6(IO6)
ENCODER_B: C22.2 R23.1 U1.4(IO4)
ENCODER_KEY: C21.2 R22.2 U1.5(IO5)
IO0: R2.1 U1.27(IO0) U6.1
IO41: U1.34(IO41)
IO42: U1.35(IO42)
KEY: R22.1 R41.1 U12.3
LCD_A: R53.1 U21.9
LCD_BL: R45.1 U1.20(IO12)
LCD_CS: U1.17(IO9) U21.5
LCD_RS: U1.11(IO18) U21.7
LCD_RST: U1.12(IO8) U21.6
LCD_SCL: U1.18(IO10) U21.4
LCD_SDA: U1.19(IO11) U21.2
LED2: R8.2 U1.39(IO1)
LED3: R7.2 U1.31(IO38)
RXD0: U1.36(RXD0) U6.3
RZ_CLK: U1.32(IO39) U19.2(A)
RZ_DATA: U1.33(IO40) U18.2(A)
RZ_OE: R14.1 U1.38(IO2) U18.1(OE#) U19.1(OE#)
TXD0: U1.37(TXD0) U6.4
USB_DN: D2.1 D2.6 R20.2 U1.13(IO19)
USB_DP: D2.3 D2.4 R47.1 U1.14(IO20)
$1N288: R15.1 U2.2(RE#) U2.3(DE) U20.4(Y)
$1N299: R11.2 U18.4(Y)
$1N306: U2.1(R) U3.1(B2)
$1N311: U2.4(D) U3.8(B1)
$1N321: CN1.2 D1.2 R11.1
$1N328: R13.2 U19.4(Y)
$1N333: CN1.3 D1.1 R13.1
$1N357: R10.2 U2.7(B)
$1N358: R9.2 U2.6(A)
$1N435: LED4.1(A) R6.1
$1N437: D8.2 F1.1
$1N442: L1.1 R10.1
$1N443: L1.2 R9.1
$1N447: LED2.1(+) R8.1
$1N449: LED3.1(+) R7.1
$1N474: CN2.2 L1.4 R12.2 R17.1 U14.2(A)
$1N476: CN2.3 L1.3 R12.1 R18.2 U13.2(A)
$1N486: R5.1 USB1.B5(CC2)
$1N487: R4.1 USB1.A5(CC1)
$1N493: R51.2 U1.26(IO45)
$1N494: R50.2 U1.16(IO46)
$2N13: D9.2(A) Q4.4(G) R39.2
$2N41: C27.2 C28.2 D7.2 U17.3(+VO/GND)
$2N58: Q5.3(C) U10.2
$2N66: C25.2 C26.1 D9.1(K) Q4.1(S) Q4.2(S) Q4.3(S) U17.1(+VIN)
$2N68: F2.2 Q4.5(D)
$2N72: Q5.1(B) R24.2
$2N73: Q5.2(E) R44.2
$2N112: Q6.3(D) R53.2
$2N131: Q6.1(G) R45.2 R52.1

Not connected (* = marked no-connect by the designer): SW1 3 4; U1 15(IO3)* 28(IO35)* 29(IO36)* 30(IO37)*; U10 3 4; U17 4(Trim) 6(Ctrl); U21 3; USB1 A8(SBU1)* B8(SBU2)*

## Notes on the sheets
sheet 1
- M5 归零码模块
- M4 RS485模块
- M3 MCU模块
- M1 USB模块
- M2 电源模块
sheet 2
- DC DC 模块
- 2.0 Display
- 蜂鸣器
- 旋转编码器
